# Altium schematic sheet Project_Overview.SchDoc
size A4; Organization: Arribada Initiative; Address1: https://github.com/arribada; Address2: contact@arribada.org; Address3: arribada.org; Address4: UK - Portsmouth; DocumentNumber: 1; SheetNumber: 1; SheetTotal: 2
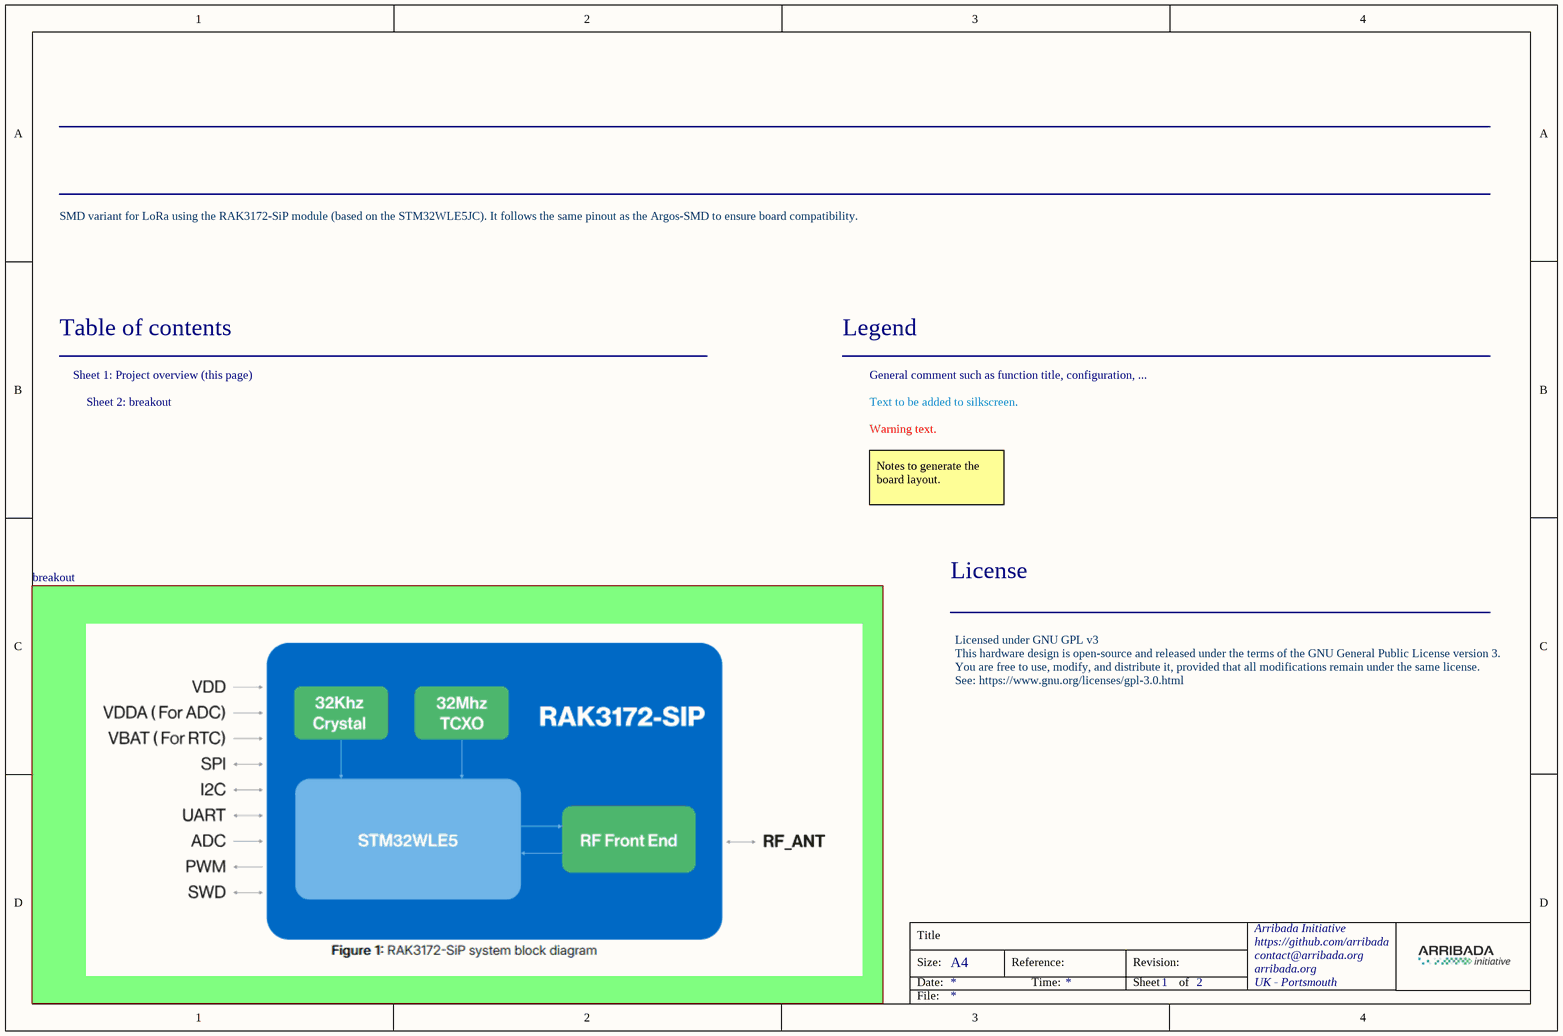
[diagram p0: Project_Overview.SchDoc]

## Sub-sheets
breakout = breakout.SchDoc: no entries

## Notes on the sheet
- SMD variant for LoRa using the RAK3172-SiP module (based on the STM32WLE5JC). It follows the same pinout as the Argos-SMD to ensure board compatibility.
- Table of contents
- Sheet 1: Project overview (this page)
- Legend
- General comment such as function title, configuration, ...
- Sheet 2: breakout
- Text to be added to silkscreen.
- Warning text.
- Notes to generate the board layout.
- License
- Licensed under GNU GPL v3
  This hardware design is open-source and released under the terms of the GNU General Public License version 3. You are free to use, modify, and distribute it, provided that all modifications remain under the same license.
  See: https://www.gnu.org/licenses/gpl-3.0.html
- Title
- Size:
- Date:
- A4
- Reference:
- Time:
- Revision:
- Sheet
- of
- File: